# Altium schematic sheet Top_Sheet.SchDoc
size A4; DocumentNumber: 1; SheetNumber: 1; SheetTotal: 8
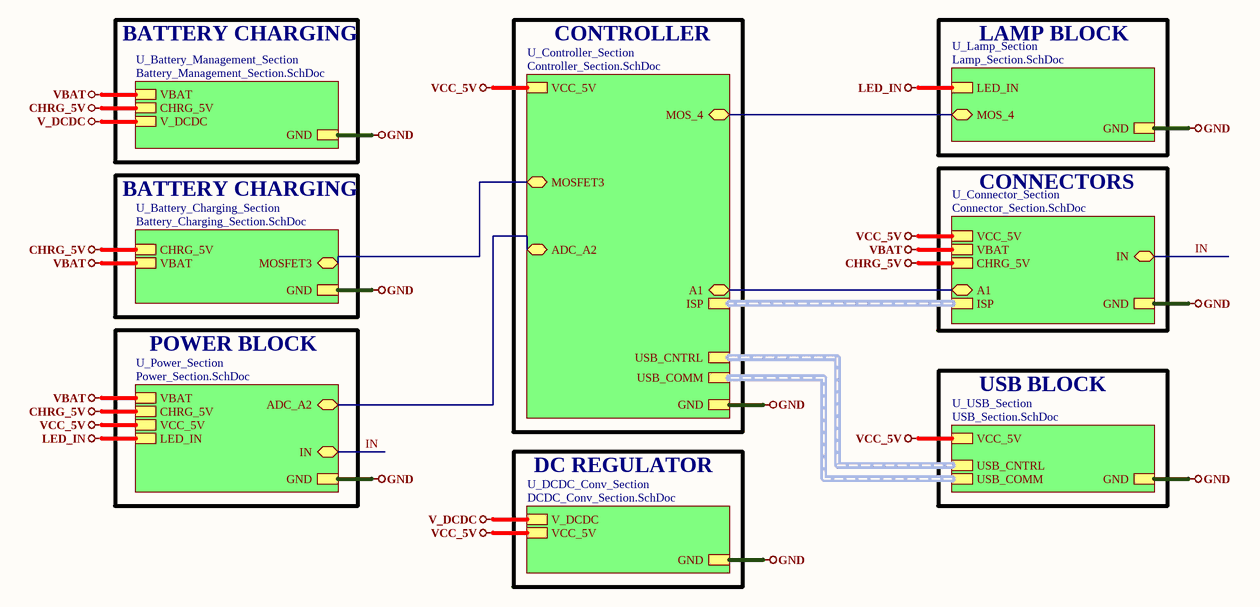
[diagram p0: Top_Sheet.SchDoc]

## Sub-sheets
U_Battery_Charging_Section = Battery_Charging_Section.SchDoc: GND, CHRG_5V, VBAT, MOSFET3 (bidir)
U_Battery_Management_Section = Battery_Management_Section.SchDoc: GND, V_DCDC, CHRG_5V, VBAT
U_Connector_Section = Connector_Section.SchDoc: VBAT, GND, VCC_5V, CHRG_5V, IN (bidir), A1 (bidir), ISP (harness ISP)
U_Controller_Section = Controller_Section.SchDoc: ISP (harness ISP), GND, VCC_5V, A1 (bidir), ADC_A2 (bidir), MOS_4 (bidir), USB_COMM (harness USB_COMM), MOSFET3 (bidir), USB_CNTRL (harness USB_CNTRL)
U_DCDC_Conv_Section = DCDC_Conv_Section.SchDoc: GND, VCC_5V, V_DCDC
U_Lamp_Section = Lamp_Section.SchDoc: MOS_4 (bidir), GND, LED_IN
U_Power_Section = Power_Section.SchDoc: ADC_A2 (bidir), IN (bidir), GND, VCC_5V, CHRG_5V, VBAT, LED_IN
U_USB_Section = USB_Section.SchDoc: GND, VCC_5V, USB_CNTRL (harness USB_CNTRL), USB_COMM (harness USB_COMM)

## Nets
CHRG_5V: sheet U_Battery_Charging_Section/CHRG_5V, sheet U_Battery_Management_Section/CHRG_5V, sheet U_Connector_Section/CHRG_5V, sheet U_Power_Section/CHRG_5V
GND: sheet U_Controller_Section/GND, sheet U_Battery_Charging_Section/GND, sheet U_Battery_Management_Section/GND, sheet U_Connector_Section/GND, sheet U_Power_Section/GND, sheet U_DCDC_Conv_Section/GND, sheet U_Lamp_Section/GND, sheet U_USB_Section/GND
LED_IN: sheet U_Power_Section/LED_IN, sheet U_Lamp_Section/LED_IN
V_DCDC: sheet U_Battery_Management_Section/V_DCDC, sheet U_DCDC_Conv_Section/V_DCDC
VBAT: sheet U_Battery_Charging_Section/VBAT, sheet U_Battery_Management_Section/VBAT, sheet U_Connector_Section/VBAT, sheet U_Power_Section/VBAT
VCC_5V: sheet U_Controller_Section/VCC_5V, sheet U_Connector_Section/VCC_5V, sheet U_Power_Section/VCC_5V, sheet U_DCDC_Conv_Section/VCC_5V, sheet U_USB_Section/VCC_5V
IN: sheet U_Connector_Section/IN, sheet U_Power_Section/IN
(unnamed): sheet U_Controller_Section/A1, sheet U_Connector_Section/A1
(unnamed): sheet U_Controller_Section/ADC_A2, sheet U_Power_Section/ADC_A2
(unnamed): sheet U_Controller_Section/MOS_4, sheet U_Lamp_Section/MOS_4
(unnamed): sheet U_Controller_Section/MOSFET3, sheet U_Battery_Charging_Section/MOSFET3

## Buses and harness runs
harness sheet U_Connector_Section/ISP = sheet U_Controller_Section/ISP
harness sheet U_Controller_Section/USB_CNTRL = sheet U_USB_Section/USB_CNTRL
harness sheet U_Controller_Section/USB_COMM = sheet U_USB_Section/USB_COMM

## Notes on the sheet
- BATTERY CHARGING
- CONTROLLER
- LAMP BLOCK
- CONNECTORS
- POWER BLOCK
- USB BLOCK
- DC REGULATOR